# Altium project 9269 RR Module Controller.PrjPcb (part 2 of 2)

## Sheet Sheet3.SchDoc
size B; DrawnBy: DMK; DocumentNumber: 3; Revision: A; SheetNumber: 3; SheetTotal: 3
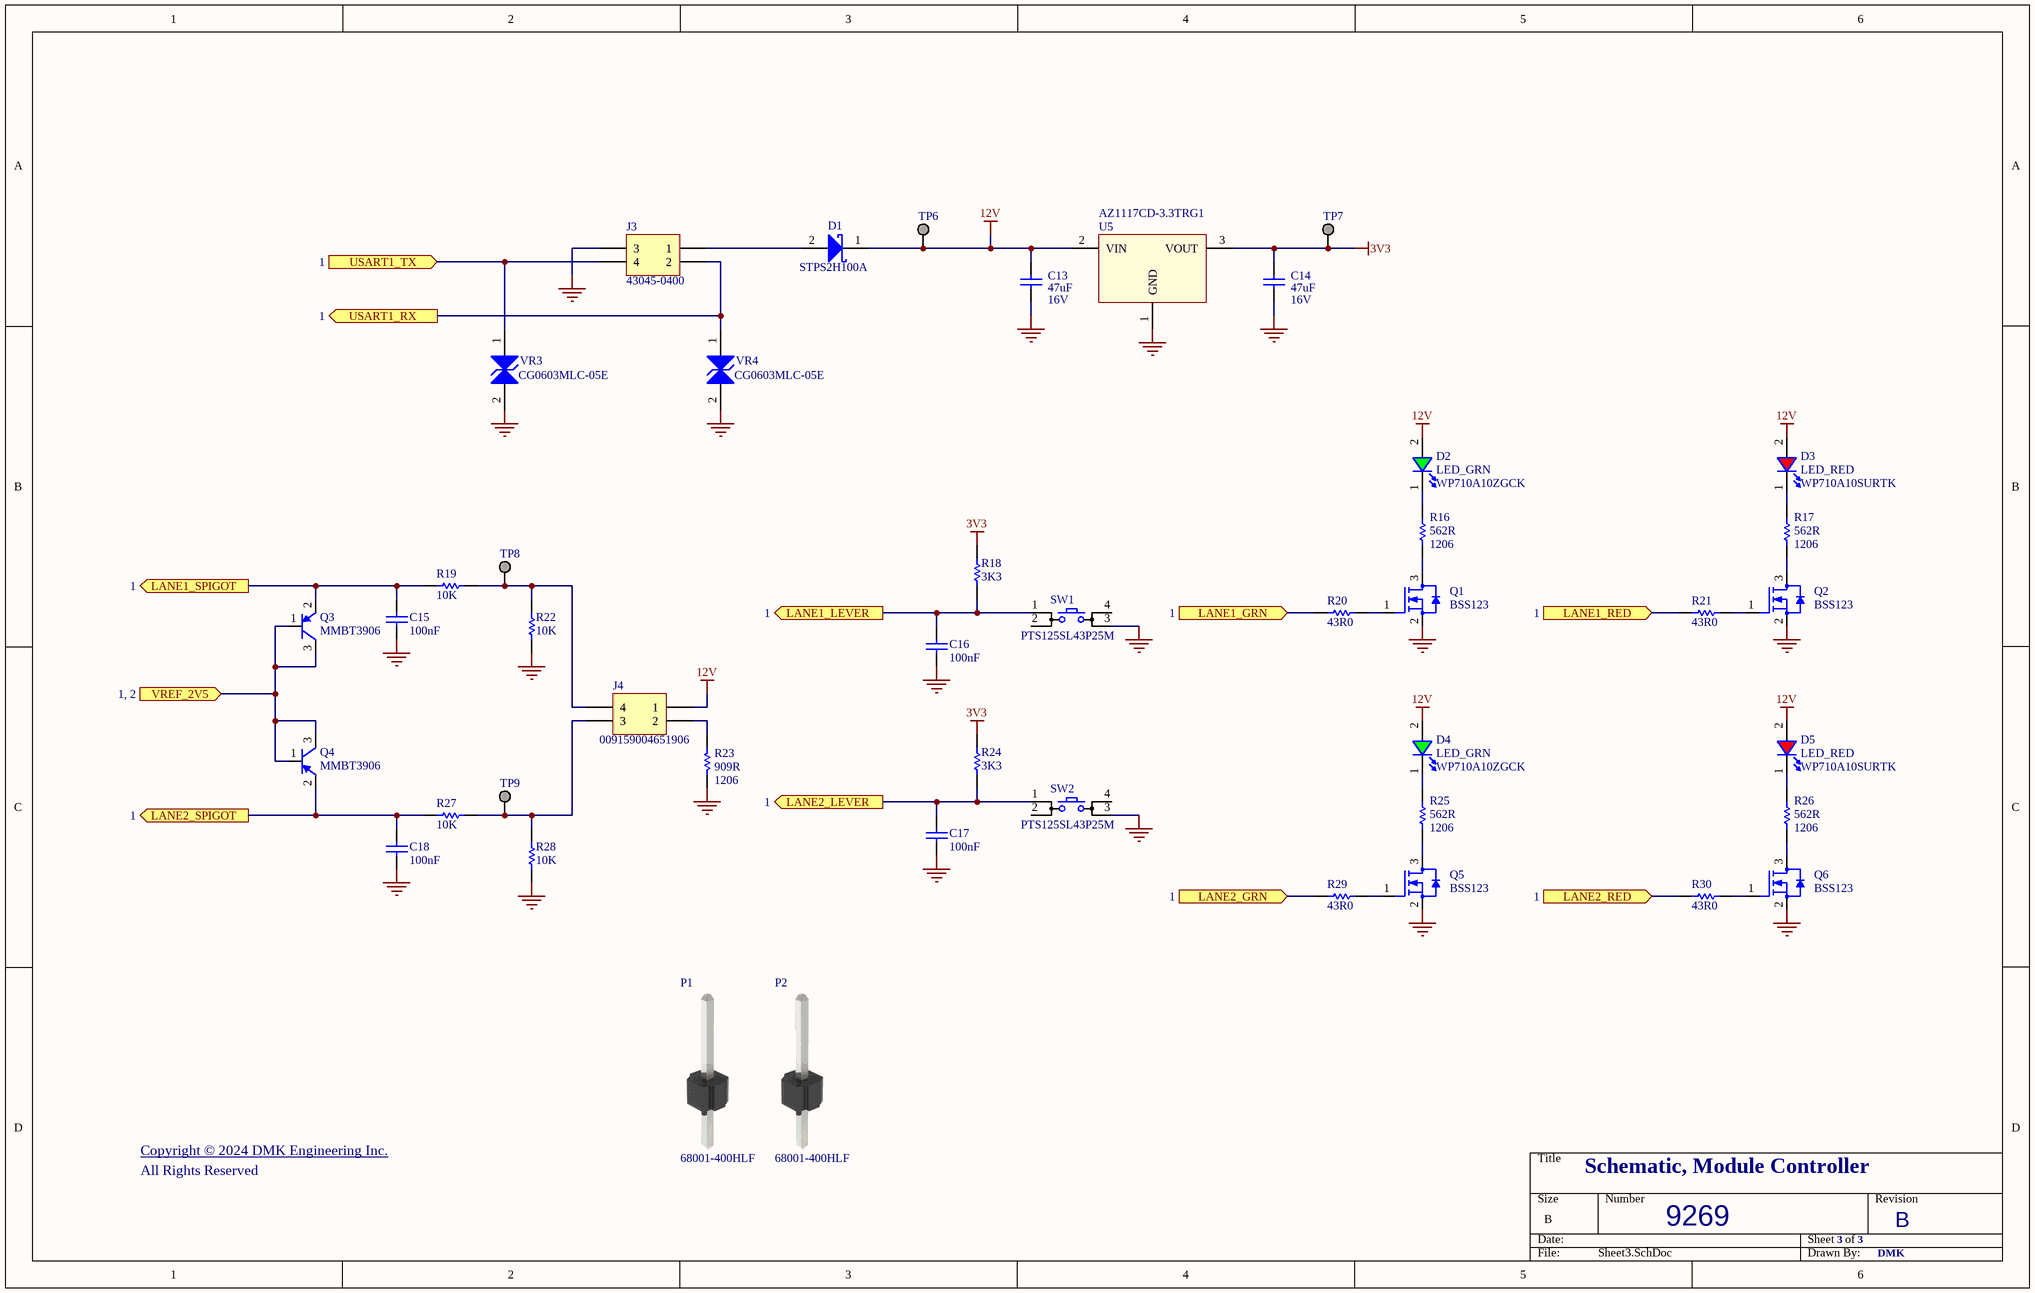
[diagram p2: Sheet3.SchDoc]

### Parts
C13  47uF  Voltage Rating: 16V  [C_1210]
C14  47uF  Voltage Rating: 16V  [C_1210]
C15  100nF  [C_0603]
C16  100nF  [C_0603]
C17  100nF  [C_0603]
C18  100nF  [C_0603]
D1  Manufacturer Part Number: STPS2H100A  [DO-214AC (SMA)]  (hidden comment: DIODE SCHOTTKY)
D2  LED_GRN  Manufacturer Part Number: WP710A10ZGCK  [LED_T1_GRN]
D3  LED_RED  Manufacturer Part Number: WP710A10SURTK  [LED_T1_RED]
D4  LED_GRN  Manufacturer Part Number: WP710A10ZGCK  [LED_T1_GRN]
D5  LED_RED  Manufacturer Part Number: WP710A10SURTK  [LED_T1_RED]
J3  Manufacturer Part Number: 43045-0400  [MOLEX 43045-0400]  (hidden comment: Header 2X2A)
J4  Manufacturer Part Number: 009159004651906  [Kyocera 009159004651906]  (hidden comment: Header 2x2)
P1  Manufacturer Part Number: 68001-400HLF  (hidden comment: Pin 25mil Square)
P2  Manufacturer Part Number: 68001-400HLF  (hidden comment: Pin 25mil Square)
Q1  Manufacturer Part Number: BSS123  [SOT23-3]  (hidden comment: NMOS-2)
Q2  Manufacturer Part Number: BSS123  [SOT23-3]  (hidden comment: NMOS-2)
Q3  MMBT3906  [SOT23-3]
Q4  MMBT3906  [SOT23-3]
Q5  Manufacturer Part Number: BSS123  [SOT23-3]  (hidden comment: NMOS-2)
Q6  Manufacturer Part Number: BSS123  [SOT23-3]  (hidden comment: NMOS-2)
R16  562R  Case/Package: 1206  [R_1206]
R17  562R  Case/Package: 1206  [R_1206]
R18  3K3  [R_0603]
R19  10K  [R_0603]
R20  43R0  [R_0603]
R21  43R0  [R_0603]
R22  10K  [R_0603]
R23  909R  Case/Package: 1206  [R_1206]
R24  3K3  [R_0603]
R25  562R  Case/Package: 1206  [R_1206]
R26  562R  Case/Package: 1206  [R_1206]
R27  10K  [R_0603]
R28  10K  [R_0603]
R29  43R0  [R_0603]
R30  43R0  [R_0603]
SW1  PTS125SL43P25M  [SWITCH PUSHBUTTON C&K PTS125]
SW2  PTS125SL43P25M  [SWITCH PUSHBUTTON C&K PTS125]
TP6  TEST POINT  [TP]  (value not drawn)  (no BOM)
TP7  TEST POINT  [TP]  (value not drawn)  (no BOM)
TP8  TEST POINT  [TP]  (value not drawn)  (no BOM)
TP9  TEST POINT  [TP]  (value not drawn)  (no BOM)
U5  Manufacturer Part Number: AZ1117CD-3.3TRG1  [DPAK (TO-252) Large]  (hidden comment: Voltage Regulator DPAK)
VR3  Manufacturer Part Number: CG0603MLC-05E  [BEAD_0603]  (hidden comment: TVS Diode Bidirectional)
VR4  Manufacturer Part Number: CG0603MLC-05E  [BEAD_0603]  (hidden comment: TVS Diode Bidirectional)

### Ports
LANE1_GRN (in, see 1), LANE1_LEVER (out, see 1), LANE1_RED (in, see 1), LANE1_SPIGOT (out, see 1), LANE2_GRN (in, see 1), LANE2_LEVER (out, see 1), LANE2_RED (in, see 1), LANE2_SPIGOT (out, see 1), USART1_RX (out, see 1), USART1_TX (in, see 1), VREF_2V5 (in, see 1, 2)

### Nets
3V3: C14.2 R18.2 R24.2 TP7.1 U5.3(VOUT)
12V: C13.2 D1.1(K) D2.2(A) D3.2(A) D4.2(A) D5.2(A) J4.1 TP6.1 U5.2(VIN)
GND: C13.1 C14.1 C15.1 C16.1 C17.1 C18.1 J3.3 Q1.2(S) Q2.2(S) Q5.2(S) Q6.2(S) R22.2 R23.1 R28.2 SW1.3 SW2.3 U5.1(GND) VR3.2(A) VR4.2(A)
VREF_2V5: Q3.1(B) Q3.3(C) Q4.1(B) Q4.3(C) ; port VREF_2V5
NetC15_2: C15.2 Q3.2(E) R19.1 ; port LANE1_SPIGOT
NetC16_2: C16.2 R18.1 SW1.1 ; port LANE1_LEVER
NetC17_2: C17.2 R24.1 SW2.1 ; port LANE2_LEVER
NetC18_2: C18.2 Q4.2(E) R27.1 ; port LANE2_SPIGOT
NetD1_2: D1.2(A) J3.1
NetD2_1: D2.1(K) R16.2
NetD3_1: D3.1(K) R17.2
NetD4_1: D4.1(K) R25.2
NetD5_1: D5.1(K) R26.2
NetJ3_2: J3.2 VR4.1(K) ; port USART1_RX
NetJ3_4: J3.4 VR3.1(K) ; port USART1_TX
NetJ4_2: J4.2 R23.2
NetJ4_3: J4.3 R27.2 R28.1 TP9.1
NetJ4_4: J4.4 R19.2 R22.1 TP8.1
NetQ1_1: Q1.1(G) R20.1
NetQ1_3: Q1.3(D) R16.1
NetQ2_1: Q2.1(G) R21.1
NetQ2_3: Q2.3(D) R17.1
NetQ5_1: Q5.1(G) R29.1
NetQ5_3: Q5.3(D) R25.1
NetQ6_1: Q6.1(G) R30.1
NetQ6_3: Q6.3(D) R26.1
NetR20_2: R20.2 ; port LANE1_GRN
NetR21_2: R21.2 ; port LANE1_RED
NetR29_2: R29.2 ; port LANE2_GRN
NetR30_2: R30.2 ; port LANE2_RED

Not connected (* = marked no-connect by the designer): SW1 2 4; SW2 2 4

### Notes on the sheet
- Copyright © 2024 DMK Engineering Inc. <www.dmkeng.com>
- All Rights Reserved

### Library data of the parts
C13 C14 = CAP: Multilayer Ceramic Capacitor, 47 uF, 16 V, ± 10%, X5R, 1210 [3225 Metric]; Manufacturer: Samsung; Manufacturer Part Number: CL32A476KOJNNNE; Material: 4241ConductorMaterial; Capacitance: 47uF; Supplier 1: Mouser; Supplier Part Number 1: 187-CL32A476KOJNNNE; RoHS: Yes; Category: Ceramic Capacitors; Stock 1: 246355; Pricing 1: 1=0.65, 10=0.386, 50=0.386, 100=0.249, 1000=0.204, 2000=0.185, 10000=0.168, 25000=0.164, 50000=0.161 (USD); Mounting Technology: Surface Mount; Case/Package: 1210; Case Code (Metric): 3225; Case Code (Imperial): 1210; Min Operating Temperature: -55°C; Max Operating Temperature: 85°C; Package Quantity: 1; Packaging: Cut Tape; Value: 47uF; Tolerance: 10%; Voltage Rating (DC): 16V; Series: CL; Dielectric: X5R; Length: 0.126inch; Width: 0.098inch; Height: 2.8mm; Thickness: 0.106inch; Lead Free: Lead Free; RoHS Compliant: Yes; ComponentLink1URL: https://datasheet.ciiva.com/25785/cl32a476kojnnne-25785873.pdf?src-supplier=Digikey; ComponentLink1Description: https://datasheet.ciiva.com/25785/cl32a476kojnnne-25785873.pdf?src-supplier=Digikey
C15-C18 = CAP: CAP CER 0.1UF 50V X7R 0603; Manufacturer: Samsung; Manufacturer Part Number: CL10B104KB8NNWC; Tolerance: 10%; Capacitance: 100nF; Supplier 1: Mouser; Supplier Part Number 1: 187-CL10B104KB8NNWC; RoHS: Yes; Category: Ceramic Capacitors; Stock 1: 581862; Pricing 1: 1=0.1, 10=0.009, 50=0.009, 100=0.006, 1000=0.005, 10000=0.003 (USD); Mounting Technology: Surface Mount; Case/Package: 0603; Case Code (Metric): 1608; Case Code (Imperial): 0603; Min Operating Temperature: -55°C; Max Operating Temperature: 125°C; Package Quantity: 1; Packaging: Cut Tape; Value: 100nF; Voltage Rating: 50V; Series: CL; Length: 0.063inch; Width: 0.031inch; Thickness: 0.035inch; RoHS Compliant: Yes; ComponentLink1URL: https://datasheet.ciiva.com/25740/cl10b104kb8nnwc-25740227.pdf?src-supplier=Digikey; ComponentLink1Description: https://datasheet.ciiva.com/25740/cl10b104kb8nnwc-25740227.pdf?src-supplier=Digikey
D1 = DIODE_SMA_SCHOTTKY: Rectifier Diode, Schottky, 1 Phase, 1 Element, 2A, 100V V(RRM), Silicon, DO-214AC; Manufacturer: STMicroelectronics; Max Reverse Current: 1uA; Peak Non-Repetitive Surge Current: 75A; Forward Voltage: 880mV; Polarity: Standard; Supplier 1: Mouser; Supplier Part Number 1: 511-STPS2H100A; RoHS: Yes; Category: Rectifier Diodes; Stock 1: 49306; Pricing 1: 1=0.38, 10=0.294, 50=0.294, 100=0.177, 1000=0.115, 10000=0.088 (USD); Mounting Technology: Surface Mount; Case/Package: SMA; Pins: 2; Min Operating Temperature: -65°C; Max Operating Temperature: 175°C; Forward Current: 2A; Max Repetitive Reverse Voltage (Vrrm): 100V; Series: -; Packaging: Tape and Reel; Average Rectified Current: 2A; Max Forward Surge Current (Ifsm): 75A; Max Reverse Voltage (DC): 100V; Package Quantity: 1; Max Surge Current: 75A; Max Reverse Leakage Current: 1uA; Voltage Rating (DC): 100V; Output Current: 2A; Current Rating: 2A; Length: 4.6mm; Width: 2.95mm; Height: 2.03mm; Radiation Hardening: No; RoHS Compliant: Yes; Lead Free: Lead Free; Reach SVHC Compliant: No; ComponentLink1URL: https://datasheet.ciiva.com/14178/cd00001548-14178421.pdf?src-supplier=Distrelec; ComponentLink1Description: https://datasheet.ciiva.com/14178/cd00001548-14178421.pdf?src-supplier=Distrelec; ComponentLink2URL: https://datasheet.ciiva.com/16394/cd00001548-16394856.pdf?src-supplier=Future+Electronics; ComponentLink2Description: https://datasheet.ciiva.com/16394/cd00001548-16394856.pdf?src-supplier=Future+Electronics; ComponentLink3URL: https://datasheet.ciiva.com/7963/1724011-7963926.pdf?src-supplier=Element14; ComponentLink3Description: https://datasheet.ciiva.com/7963/1724011-7963926.pdf?src-supplier=Element14; ComponentLink4URL: https://datasheet.ciiva.com/7963/1724011-7963927.pdf?src-supplier=Element14; ComponentLink4Description: https://datasheet.ciiva.com/7963/1724011-7963927.pdf?src-supplier=Element14; ComponentLink5URL: https://datasheet.ciiva.com/916/cd00001548-916178.pdf?src-supplier=Digikey; ComponentLink5Description: https://datasheet.ciiva.com/916/cd00001548-916178.pdf?src-supplier=Digikey; ComponentLink6URL: https://datasheet.ciiva.com/916/cd00001548-916177.pdf?src-supplier=Digikey; ComponentLink6Description: https://datasheet.ciiva.com/916/cd00001548-916177.pdf?src-supplier=Digikey; ComponentLink7URL: https://datasheet.ciiva.com/916/cd00001548-916179.pdf?src-supplier=Digikey; ComponentLink7Description: https://datasheet.ciiva.com/916/cd00001548-916179.pdf?src-supplier=Digikey
D2 D4 = LED_GRN: LED Uni-Color Green 515nm 2-Pin T-1 Bulk; Manufacturer: Kingbright; Lens Color: Colorless; Viewing Angle: 34°; Lens Style: Dome,Round,Domed; Luminous Intensity: 8000mcd; Forward Current: 20mA; Forward Voltage: 3.3V; Lens Transparency: Clear; Dominant Wavelength: 525nm; Lens Size: 3mm; Supplier 1: Mouser; Supplier Part Number 1: 604-WP710A10ZGCK; RoHS: Yes; Category: LEDs; Stock 1: 2647; Pricing 1: 1=0.51, 10=0.338, 50=0.338, 100=0.226, 1000=0.155, 10000=0.149 (USD); Mounting Technology: Through Hole; Case/Package: Radial; Color: Green; Min Operating Temperature: -40°C; Max Operating Temperature: 85°C; Package Quantity: 500; Illumination Color: Green; Packaging: Bulk; Test Current: 20mA; Series: -; Height: 5.9mm; Lead Free: Lead Free; ComponentLink1URL: https://datasheet.ciiva.com/16421/wp710a10zgck-262246-16421032.pdf?src-supplier=Mouser; ComponentLink1Description: https://datasheet.ciiva.com/16421/wp710a10zgck-262246-16421032.pdf?src-supplier=Mouser; ComponentLink2URL: https://datasheet.ciiva.com/29562/wp710a10zgck-29562178.pdf?src-supplier=Digikey; ComponentLink2Description: https://datasheet.ciiva.com/29562/wp710a10zgck-29562178.pdf?src-supplier=Digikey
D3 D5 = LED_RED: LED Uni-Color Red 630nm 2-Pin T-1 Bulk; Manufacturer: Kingbright; Supplier 1: Mouser; Supplier Part Number 1: 604-WP710A10SURTK; RoHS: No; Stock 1: 50; Pricing 1: 1=0.37, 10=0.299, 50=0.299, 100=0.134, 1000=0.099, 10000=0.069 (USD)
J3 = Header 2X2A: MOLEX 43045-0400 Header, Dual Row, 90°, 4p, Tin Plating Snap-in Peg PCB Lock, GW Compatible; Plating: 154ConductorMaterial; Contact Resistance: 10mR; Number of Positions: 4; Max Voltage Rating (AC): 250V; Current Rating: 5A; Voltage Rating: 600V; Gender: Male; Max Voltage Rating (DC): 250.25kV; Pitch: 3mm; Row Spacing: 0.118inch; Approvals: UL,CSA,TUV; Glow Wire Compliant: 15Compliance; LatestRevisionDate: 17-Jul-2002; LatestRevisionNote: Re-released for DXP Platform.; Publisher: Altium Limited; Supplier 1: Mouser; Supplier Part Number 1: 538-43045-0400; Manufacturer: Molex; RoHS: Yes; Category: Headers and Wire Housings; Stock 1: 18230; Pricing 1: 1=1.53, 10=0.877, 50=0.877, 100=0.782, 558=0.739, 1000=0.739, 1116=0.693, 10000=0.693, 10044=0.593 (USD); Mounting Technology: Through Hole; Case/Package: 101Case; Contact Plating: Tin; Contact Material: Brass,Tin; Color: Black; Housing Color: Black; Housing Material: Thermoplastic; Material: Polyester; Min Operating Temperature: -40°C; Max Operating Temperature: 105°C; Number of Rows: 2; Packaging: Tray; Fastening Type: Ramp; Termination: Solder; Number of Contacts: 4; Orientation: Right Angle; Contact Gender: Male; Series: Micro-Fit 3.0™ 43045; Contact Type: Male Pin; Number of Circuits: 4; Number of Poles: 4; Voltage Rating (AC): 250V; Working Voltage: 250V; Voltage Rating (DC): 250V; Diameter: 3mm; Length: 10.15mm; Width: 9.9mm; Lead Pitch: 3mm; Depth: 12.2mm; Radiation Hardening: No; RoHS Compliant: Yes; Reach SVHC Compliant: Unknown; Flammability Rating: 5813Flammability; Halogen Free: 5696HalogenFree; Lead Free: 5697LeadFree
J4 = Header 2x2: 2x2 Position Female White Vertical Dual Row Top Entry Card Edge Connector; Manufacturer: Kyocera AVX; Supplier 1: Mouser; Supplier Part Number 1: 581-009159004651906; RoHS: No; Stock 1: 3916; Pricing 1: 1=0.99, 10=0.841, 50=0.841, 100=0.755, 1000=0.618, 10000=0.486 (USD)
P1 P2 = Pin 25mil Square: Conn Unshrouded Header HDR 2.54mm Solder ST Top Entry Thru-Hole BergStik® T/R; Manufacturer: Amphenol Communications Solutions; Connector Type: 5775ConnectorType; Current Rating: 3A; Gender: 29Gender; Insulation Resistance: 5GR; Max Voltage Rating (AC): 1.5kV; Number of Positions: 36NUMBER; Lead Length: 3.05mm; Supplier 1: Mouser; Supplier Part Number 1: 649-68001-400HLF; RoHS: No; Category: Headers and Wire Housings; Stock 1: 58726; Pricing 1: 1=0.1, 10=0.03, 50=0.03, 100=0.022, 1000=0.018, 10000=0.015 (USD); Mounting Technology: 9Mount; Color: 46Colour; Contact Material: 150ConductorMaterial; Contact Plating: 154ConductorMaterial; Housing Color: 46Colour; Housing Material: 4896ConductorMaterial; Min Operating Temperature: -65°C; Max Operating Temperature: 125°C; Contact Gender: 29Gender; Number of Rows: 1NUMBER; Orientation: 5491OrientationType; Termination: 4558ConnectorType; Voltage Rating: 1.5kV; Voltage Rating (DC): 1.5kV; Length: 2.54mm; Contact Mating Length: 5.842mm; Depth: 2.41mm; Lead Pitch: 1.27mm; Pitch: 2.54mm; Flammability Rating: 5813Flammability; Lead Free: 5697LeadFree
Q1 Q2 Q5 Q6 = NMOS-2: Transistor MOSFET Negative Channel 100 Volt 0.17A 3-Pin SOT-23; Manufacturer: ON Semiconductor / Fairchild; Note: Pin 2 is electrically connected to pin 4.; Max Power Dissipation: 360mW; Drain to Source Voltage (Vdss): 100V; Input Capacitance: 73pF; Continuous Drain Current (ID): 170mA; Rds On Max: 6R; Turn-Off Delay Time: 17ns; Gate to Source Voltage (Vgs): 20V; Polarity: N-CHANNEL; Turn-On Delay Time: 1.7ns; Rise Time: 9ns; Nominal Vgs: 1.7V; Number of Elements: 1; Number of Channels: 1NUMBER; Published: 8-Jun-2000; LatestRevisionDate: 17-Jul-2002; LatestRevisionNote: Re-released for DXP Platform.; DatasheetVersion: PD-9.814; PackageVersion: Feb-1997; PackageReference: TO-220AB; Publisher: Altium Limited; PackageDescription: TO, Thru-Hole, Vertical, Heatsink Mounted; 3 In-Line Leads; Pitch 2.54 mm; ComponentLink1Description: Manufacturer Link; ComponentLink1URL: http://www.irf.com/; Supplier 1: Mouser; Supplier Part Number 1: 512-BSS123; RoHS: Yes; Category: MOSFETs; Stock 1: 1883; Pricing 1: 1=0.35, 10=0.261, 50=0.261, 100=0.148, 1000=0.075, 10000=0.052 (USD); Mounting Technology: Surface Mount; Case/Package: SOT-23; Pins: 3; Min Operating Temperature: -55°C; Max Operating Temperature: 150°C; Packaging: Tape and Reel; Package Quantity: 1; Series: -; Fall Time: 9ns; Drain to Source Resistance: 6R; Power Dissipation: 360mW; Drain to Source Breakdown Voltage: 100V; Voltage Rating (DC): 100V; Current Rating: 170mA; Threshold Voltage: 1.7V; Voltage: 100V; Drain-source On Resistance-Max: 6R; Dual Supply Voltage: 100V; Length: 2.92mm; Width: 1.3mm; Height: 0.93mm; Radiation Hardening: No; Lead Free: Lead Free; RoHS Compliant: Yes; Reach SVHC Compliant: No; ComponentLink2URL: https://datasheet.ciiva.com/3304/bss123-3304416.pdf?src-supplier=Avnet; ComponentLink2Description: https://datasheet.ciiva.com/3304/bss123-3304416.pdf?src-supplier=Avnet; ComponentLink3URL: https://datasheet.ciiva.com/4441/bss123-90724-4441226.pdf?src-supplier=Mouser; ComponentLink3Description: https://datasheet.ciiva.com/4441/bss123-90724-4441226.pdf?src-supplier=Mouser; ComponentLink4URL: https://datasheet.ciiva.com/17170/bss123-17170795.pdf?src-supplier=Future+Electronics; ComponentLink4Description: https://datasheet.ciiva.com/17170/bss123-17170795.pdf?src-supplier=Future+Electronics
Q3 Q4 = PNP_SOT23: Transistor: 200mA 200mW PNP General-Purpose Amplifier, SOT-23, 7IN. Reel; Manufacturer: MCC; Manufacturer Part Number: MMBT3906-TP; Number of Elements: 1; Collector Emitter Voltage (VCEO): 40V; hFE Min: 60; Max Power Dissipation: 300mW; Frequency: 250MHz; Emitter Base Voltage (VEBO): 5V; Collector Emitter Saturation Voltage: -250mV; Current Rating: -2A; Voltage Rating (DC): -40V; Collector-emitter Voltage-Max: 400mV; Supplier 1: Mouser; Supplier Part Number 1: 833-MMBT3906-TP; Category: BJTs; Stock 1: 36273; Pricing 1: 1=0.1, 10=0.06, 50=0.06, 100=0.026, 1000=0.018, 3000=0.013, 9000=0.011, 10000=0.011 (USD); Mounting Technology: Surface Mount; Case/Package: SOT-23; Pins: 3; Min Operating Temperature: -55°C; Max Operating Temperature: 150°C; Package Quantity: 3000; Packaging: Tape and Reel; Max Collector Current: 200mA; Transition Frequency: 250MHz; Collector Emitter Breakdown Voltage: 40V; Max Breakdown Voltage: 40V; Polarity: PNP; Collector Base Voltage (VCBO): 40V; Power Dissipation: 300mW; Clock Frequency: 250MHz; Gain Bandwidth Product: 250MHz; Series: -; Length: 3.04mm; Width: 1.4mm; Height: 1.12mm; Radiation Hardening: No; Lead Free: Lead Free; RoHS Compliant: Yes; ComponentLink1URL: https://datasheet.ciiva.com/6362/mmbt3906sot-23-6362513.pdf?src-supplier=Digikey; ComponentLink1Description: https://datasheet.ciiva.com/6362/mmbt3906sot-23-6362513.pdf?src-supplier=Digikey; ComponentLink2URL: https://datasheet.ciiva.com/15200/getdatasheetpartid-321202-15200524.pdf?src-supplier=Verical; ComponentLink2Description: https://datasheet.ciiva.com/15200/getdatasheetpartid-321202-15200524.pdf?src-supplier=Verical; ComponentLink3URL: https://datasheet.octopart.com/MMBT3906-TP-MCC-datasheet-38265.pdf?src-supplier=Digikey; ComponentLink3Description: https://datasheet.octopart.com/MMBT3906-TP-MCC-datasheet-38265.pdf?src-supplier=Digikey; ComponentLink4URL: https://datasheet.octopart.com/MMBT3906-TP-MCC-datasheet-133517506.pdf?src-supplier=Future+Electronics; ComponentLink4Description: https://datasheet.octopart.com/MMBT3906-TP-MCC-datasheet-133517506.pdf?src-supplier=Future+Electronics; ComponentLink5URL: https://datasheet.octopart.com/MMBT3906-TP-Micro-Commercial-datasheet-13551255.pdf?src-supplier=Future+Electronics; ComponentLink5Description: https://datasheet.octopart.com/MMBT3906-TP-Micro-Commercial-datasheet-13551255.pdf?src-supplier=Future+Electronics; ComponentLink6URL: https://datasheet.octopart.com/MMBT3906-TP-Micro-Commercial-datasheet-12536892.pdf?src-supplier=Future+Electronics; ComponentLink6Description: https://datasheet.octopart.com/MMBT3906-TP-Micro-Commercial-datasheet-12536892.pdf?src-supplier=Future+Electronics; ComponentLink7URL: https://datasheet.octopart.com/MMBT3906-TP-MCC-datasheet-9940751.pdf?src-supplier=RS+(Formerly+Allied+Electronics); ComponentLink7Description: https://datasheet.octopart.com/MMBT3906-TP-MCC-datasheet-9940751.pdf?src-supplier=RS+(Formerly+Allied+Electronics)
R16 R17 R25 R26 = CMP-2002-07535-1: Res Thick Film 1206 562 Ohm 1% 0.25W(1/4W) ±100ppm/C Pad SMD T/R; Manufacturer: Yageo; Manufacturer Part Number: RC1206FR-07562RL; Power Rating: 250mW; Voltage Rating: 200V; Temperature Coefficient: 100ppm/°C; Resistance: 562R; Supplier 1: Mouser; Supplier Part Number 1: 603-RC1206FR-07562RL; RoHS: Yes; Category: Chip SMD Resistors; Stock 1: 16436; Pricing 1: 1=0.1, 10=0.024, 50=0.024, 100=0.014, 1000=0.01, 10000=0.006 (USD); Case Code (Imperial): 1206; Case Code (Metric): 3216; Min Operating Temperature: -55°C; Max Operating Temperature: 155°C; Packaging: Tape and Reel; Package Quantity: 5000; Value: 562R; Tolerance: 1%; Termination: SMD/SMT; Voltage Rating (DC): 200V; Working Voltage: 200V; Number of Terminations: 2; Features: Moisture Resistant; Series: RC; Max Power Dissipation: 250mW; Construction: Rectangular; Technology: THICK FILM; Length: 3.1mm; Width: 1.6mm; Height: 0.55mm; Depth: 1.6mm; Military Standard: Not; Lead Free: Lead Free; RoHS Compliant: Yes; ComponentLink1URL: https://datasheet.ciiva.com/16742/pyu-rc1206-51-rohs-l-4-16742492.pdf?src-supplier=Future+Electronics; ComponentLink1Description: https://datasheet.ciiva.com/16742/pyu-rc1206-51-rohs-l-4-16742492.pdf?src-supplier=Future+Electronics; ComponentLink2URL: https://datasheet.ciiva.com/15159/getdatasheetpartid-32963-15159365.pdf?src-supplier=Verical; ComponentLink2Description: https://datasheet.ciiva.com/15159/getdatasheetpartid-32963-15159365.pdf?src-supplier=Verical
R18 R24 = CMP-2002-07535-1: CRCW Thick Film Commodity Chip Resistor 0603 Size 3.3K Ohm 1% 0.1 W 100 ppm/K 2-Pin SMD Paper T/R; Manufacturer: Vishay; Manufacturer Part Number: CRCW06033K30FKEBC; Resistance: 3K3; Supplier 1: Mouser; Supplier Part Number 1: 71-CRCW06033K30FKEBC; RoHS: Yes; Category: Chip SMD Resistors; Stock 1: 56488; Pricing 1: 1=0.1, 10=0.031, 50=0.031, 100=0.013, 1000=0.006, 10000=0.004 (USD); RoHS Compliant: Yes
R19 R22 R27 R28 = CMP-2002-07535-1: SMD Chip Resistor, 10 kohm, ± 1%, 100 mW, 0603 [1608 Metric], Thick Film, Precision; Manufacturer: Panasonic; Manufacturer Part Number: ERJ-3EKF1002V; Value: 10kR; Power Rating: 100mW; Voltage Rating: 75V; Temperature Coefficient: 100ppm/°C; Resistance: 10K; Supplier 1: Mouser; Supplier Part Number 1: 667-ERJ-3EKF1002V; RoHS: Yes; Category: Chip SMD Resistors; Stock 1: 4766252; Pricing 1: 1=0.1, 10=0.02, 50=0.02, 100=0.012, 1000=0.009, 5000=0.006, 10000=0.006, 100000=0.005 (USD); Mounting Technology: Surface Mount; Case/Package: 0603; Pins: 2; Case Code (Metric): 1608; Case Code (Imperial): 0603; Contact Plating: Tin; Min Operating Temperature: -55°C; Max Operating Temperature: 155°C; Tolerance: 1%; Packaging: Tape and Reel; Package Quantity: 1; Resistor Type: Thick Film; Number of Terminations: 2; Termination: SMD/SMT; Max Power Dissipation: 100mW; Features: Automotive AEC-Q200; Series: ERJ; Technology: THICK FILM; Resistance Tolerance: 1%; Construction: Rectangular; Voltage Rating (DC): 75V; Length: 1.6mm; Width: 0.8mm; Height: 0.45mm; Depth: 0.8mm; Radiation Hardening: No; Reach SVHC Compliant: No; Military Standard: Not; RoHS Compliant: Yes; Lead Free: 5697LeadFree; ComponentLink1URL: https://datasheet.ciiva.com/16759/70260748-16759807.pdf?src-supplier=Allied+Electronics; ComponentLink1Description: https://datasheet.ciiva.com/16759/70260748-16759807.pdf?src-supplier=Allied+Electronics
R20 R21 R29 R30 = CMP-2002-07535-1: CRCW Thick Film Commodity Chip Resistor 0603 Size 43 Ohm 1% 0.1 W 100 ppm/K 2-Pin SMD Paper T/R; Manufacturer: Vishay; Manufacturer Part Number: CRCW060343R0FKEAC; Value: 43R; Resistance: 43R0; Supplier 1: Mouser; Supplier Part Number 1: 71-CRCW060343R0FKEAC; RoHS: Yes; Category: Chip SMD Resistors; Stock 1: 77921; Pricing 1: 1=0.1, 10=0.018, 50=0.018, 100=0.008, 1000=0.006, 10000=0.003 (USD); Case/Package: 345Case; Lead Free: 5697LeadFree
R23 = CMP-2002-07535-1: Res Thick Film 1206 909 Ohm 1% 0.25W(1/4W) ±100ppm/C Pad SMD T/R; Manufacturer: Yageo; Manufacturer Part Number: RC1206FR-07909RL; Power Rating: 250mW; Voltage Rating: 200V; Temperature Coefficient: 100ppm/°C; Resistance: 909R; Supplier 1: Mouser; Supplier Part Number 1: 603-RC1206FR-07909RL; RoHS: Yes; Category: Chip SMD Resistors; Stock 1: 11665; Pricing 1: 1=0.1, 10=0.025, 50=0.025, 100=0.015, 1000=0.013, 10000=0.006 (USD); Case Code (Imperial): 1206; Case Code (Metric): 3216; Weight: 0.000571oz; Min Operating Temperature: -55°C; Max Operating Temperature: 155°C; Value: 909R; Tolerance: 1%; Packaging: Tape and Reel; Termination: SMD/SMT; Voltage Rating (DC): 200V; Features: Moisture Resistant; Series: RC; Max Power Dissipation: 250mW; Number of Terminations: 2; Length: 3.2mm; Width: 1.6mm; Height: 0.55mm; Lead Free: Lead Free; RoHS Compliant: Yes; ComponentLink1URL: https://datasheet.ciiva.com/16745/pyu-rc1206-51-rohs-l-4-16745945.pdf?src-supplier=Future+Electronics; ComponentLink1Description: https://datasheet.ciiva.com/16745/pyu-rc1206-51-rohs-l-4-16745945.pdf?src-supplier=Future+Electronics
SW1 SW2 = SW Pushbutton: PTS125 Series 50 mA 12 V SPST-NO Off-Mom Through Hole Tactile Switch; Manufacturer: ITT C&K; Manufacturer Part Number: PTS125SL43P25MLFS; Supplier 1: Mouser; Supplier Part Number 1: 611-PTS125SL43P25LFS; RoHS: No; Category: Uncategorized; Stock 1: 14281; Pricing 1: 1=0.43, 10=0.392, 50=0.392, 100=0.309, 1000=0.257, 10000=0.222 (USD); RoHS Compliant: No
TP6-TP9 = TEST POINT: Part of PCB
U5 = Voltage Regulator DPAK: 1.35A 3.3V LDO Reg. Current Limit TO-252 | Diodes Inc AZ1117CD-3.3TRG1; Dropout Voltage: 1.3V; Number of Outputs: 1; Max Supply Voltage: 15V; Output Current: 800mA; Min Current Limit: 1A; Polarity: Positive; Quiescent Current: 4mA; Reference Voltage: 1.262V; Accuracy: 1%; Output Type: Fixed; Number of Channels: 1NUMBER; Supplier 1: Mouser; Supplier Part Number 1: 621-AZ1117CD-3.3TRG1; Manufacturer: Diodes; RoHS: Yes; Category: Voltage Regulators - Linear; Stock 1: 13050; Pricing 1: 1=0.44, 10=0.321, 50=0.321, 100=0.18, 1000=0.133, 10000=0.115 (USD); Mounting Technology: Surface Mount; Case/Package: TO-252-3; Pins: 3; Min Operating Temperature: -20°C; Max Operating Temperature: 125°C; Package Quantity: 1; Packaging: Tape and Reel; Output Voltage: 3.3V; Number of Regulators: 1; Max Output current: 1.35A; Series: AZ1117CD; Length: 6.7mm; Width: 6.2mm; Height: 2.39mm; Lead Free: Lead Free; RoHS Compliant: Yes; ComponentLink1URL: https://datasheet.ciiva.com/29568/az1117c-29568368.pdf?src-supplier=Digikey; ComponentLink1Description: https://datasheet.ciiva.com/29568/az1117c-29568368.pdf?src-supplier=Digikey; ComponentLink2URL: https://datasheet.ciiva.com/29568/az1117c-29568366.pdf?src-supplier=Digikey; ComponentLink2Description: https://datasheet.ciiva.com/29568/az1117c-29568366.pdf?src-supplier=Digikey; ComponentLink3URL: https://datasheet.ciiva.com/29568/az1117c-29568367.pdf?src-supplier=Digikey; ComponentLink3Description: https://datasheet.ciiva.com/29568/az1117c-29568367.pdf?src-supplier=Digikey; ComponentLink4URL: https://datasheet.ciiva.com/30016/az1117c-30016668.pdf?src-supplier=Avnet; ComponentLink4Description: https://datasheet.ciiva.com/30016/az1117c-30016668.pdf?src-supplier=Avnet
VR3 VR4 = TVS Diode Bidirectional: ESD Suppressor Multilayer Varistor 5V Automotive 2-Pin Case 0603(1608Metric) T/R; Manufacturer: Bourns; Current Rating: 50nA; Value: 0.5pF; Voltage Rating (AC): 8V; Number of Channels: 1; Clamping Voltage: 20V; Supplier 1: Mouser; Supplier Part Number 1: 652-CG0603MLC-05E; RoHS: Yes; Category: Varistors; Stock 1: 20474; Pricing 1: 1=0.36, 10=0.232, 50=0.232, 100=0.139, 1000=0.1, 5000=0.094, 10000=0.086, 25000=0.08, 50000=0.072, 100000=0.069 (USD); Case/Package: 0603; Pins: 2; Case Code (Imperial): 0603; Case Code (Metric): 1608; Contact Plating: Tin; Min Operating Temperature: -40°C; Max Operating Temperature: 85°C; Package Quantity: 1; Packaging: Tape and Reel; Termination: SMD/SMT; Series: MLC; Voltage Rating (DC): 5V; Operating Supply Voltage: 5V; Voltage: 5V; Number of Circuits: 1; Max Voltage Rating (DC): 5V; Working Voltage: 5V; Leakage Current: 50nA; Length: 1.6mm; Width: 0.8mm; Depth: 0.8mm; Thickness: 0.8mm; Radiation Hardening: No; Reach SVHC Compliant: No; RoHS Compliant: Yes; ComponentLink1URL: https://datasheet.ciiva.com/1278/1785244-1278701.pdf?src-supplier=Element14; ComponentLink1Description: https://datasheet.ciiva.com/1278/1785244-1278701.pdf?src-supplier=Element14; ComponentLink2URL: https://datasheet.ciiva.com/22696/1785244-22696318.pdf?src-supplier=Element14; ComponentLink2Description: https://datasheet.ciiva.com/22696/1785244-22696318.pdf?src-supplier=Element14; ComponentLink3URL: https://datasheet.ciiva.com/8084/mlc-8084047.pdf?src-supplier=Avnet; ComponentLink3Description: https://datasheet.ciiva.com/8084/mlc-8084047.pdf?src-supplier=Avnet; ComponentLink4URL: https://datasheet.ciiva.com/6991/mlc-6991836.pdf?src-supplier=Digikey; ComponentLink4Description: https://datasheet.ciiva.com/6991/mlc-6991836.pdf?src-supplier=Digikey; ComponentLink5URL: https://datasheet.ciiva.com/6991/mlc-6991832.pdf?src-supplier=Digikey; ComponentLink5Description: https://datasheet.ciiva.com/6991/mlc-6991832.pdf?src-supplier=Digikey

## Nets that join several sheets
3V3: Sheet1 (7 pins), Sheet2 (R8.1 R12.1 U3.14 U4.14), Sheet3 (5 pins)
12V: Sheet2 (7 pins), Sheet3 (9 pins)
GND: Sheet1 (16 pins), Sheet2 (19 pins), Sheet3 (19 pins)
NetC15_2: Sheet1 (U1.12), Sheet3 (C15.2 Q3.2 R19.1)
NetC16_2: Sheet1 (U1.40), Sheet3 (C16.2 R18.1 SW1.1)
NetC17_2: Sheet1 (U1.43), Sheet3 (C17.2 R24.1 SW2.1)
NetC18_2: Sheet1 (U1.11), Sheet3 (C18.2 Q4.2 R27.1)
NetJ3_2: Sheet1 (R4.2), Sheet3 (J3.2 VR4.1)
NetJ3_4: Sheet1 (R5.2), Sheet3 (J3.4 VR3.1)
NetR20_2: Sheet1 (U1.38), Sheet3 (R20.2)
NetR21_2: Sheet1 (U1.37), Sheet3 (R21.2)
NetR29_2: Sheet1 (U1.47), Sheet3 (R29.2)
NetR30_2: Sheet1 (U1.48), Sheet3 (R30.2)
NetU1_1: Sheet1 (U1.1), Sheet2 (U3.2)
NetU1_2: Sheet1 (U1.2), Sheet2 (U3.16)
NetU1_3: Sheet1 (U1.3), Sheet2 (U4.3)
NetU1_4: Sheet1 (U1.4), Sheet2 (U4.1)
NetU1_17: Sheet1 (U1.17), Sheet2 (U3.3)
NetU1_19: Sheet1 (U1.19), Sheet2 (U3.1)
NetU1_20: Sheet1 (U1.20), Sheet2 (U4.16)
NetU1_22: Sheet1 (U1.22), Sheet2 (U4.2)
VREF_2V5: Sheet1 (6 pins), Sheet2 (R10.1 R14.1), Sheet3 (Q3.1 Q3.3 Q4.1 Q4.3)